# Altium project 24V-70A-Power-Board-v1.0.PrjPcb (part 3 of 8)
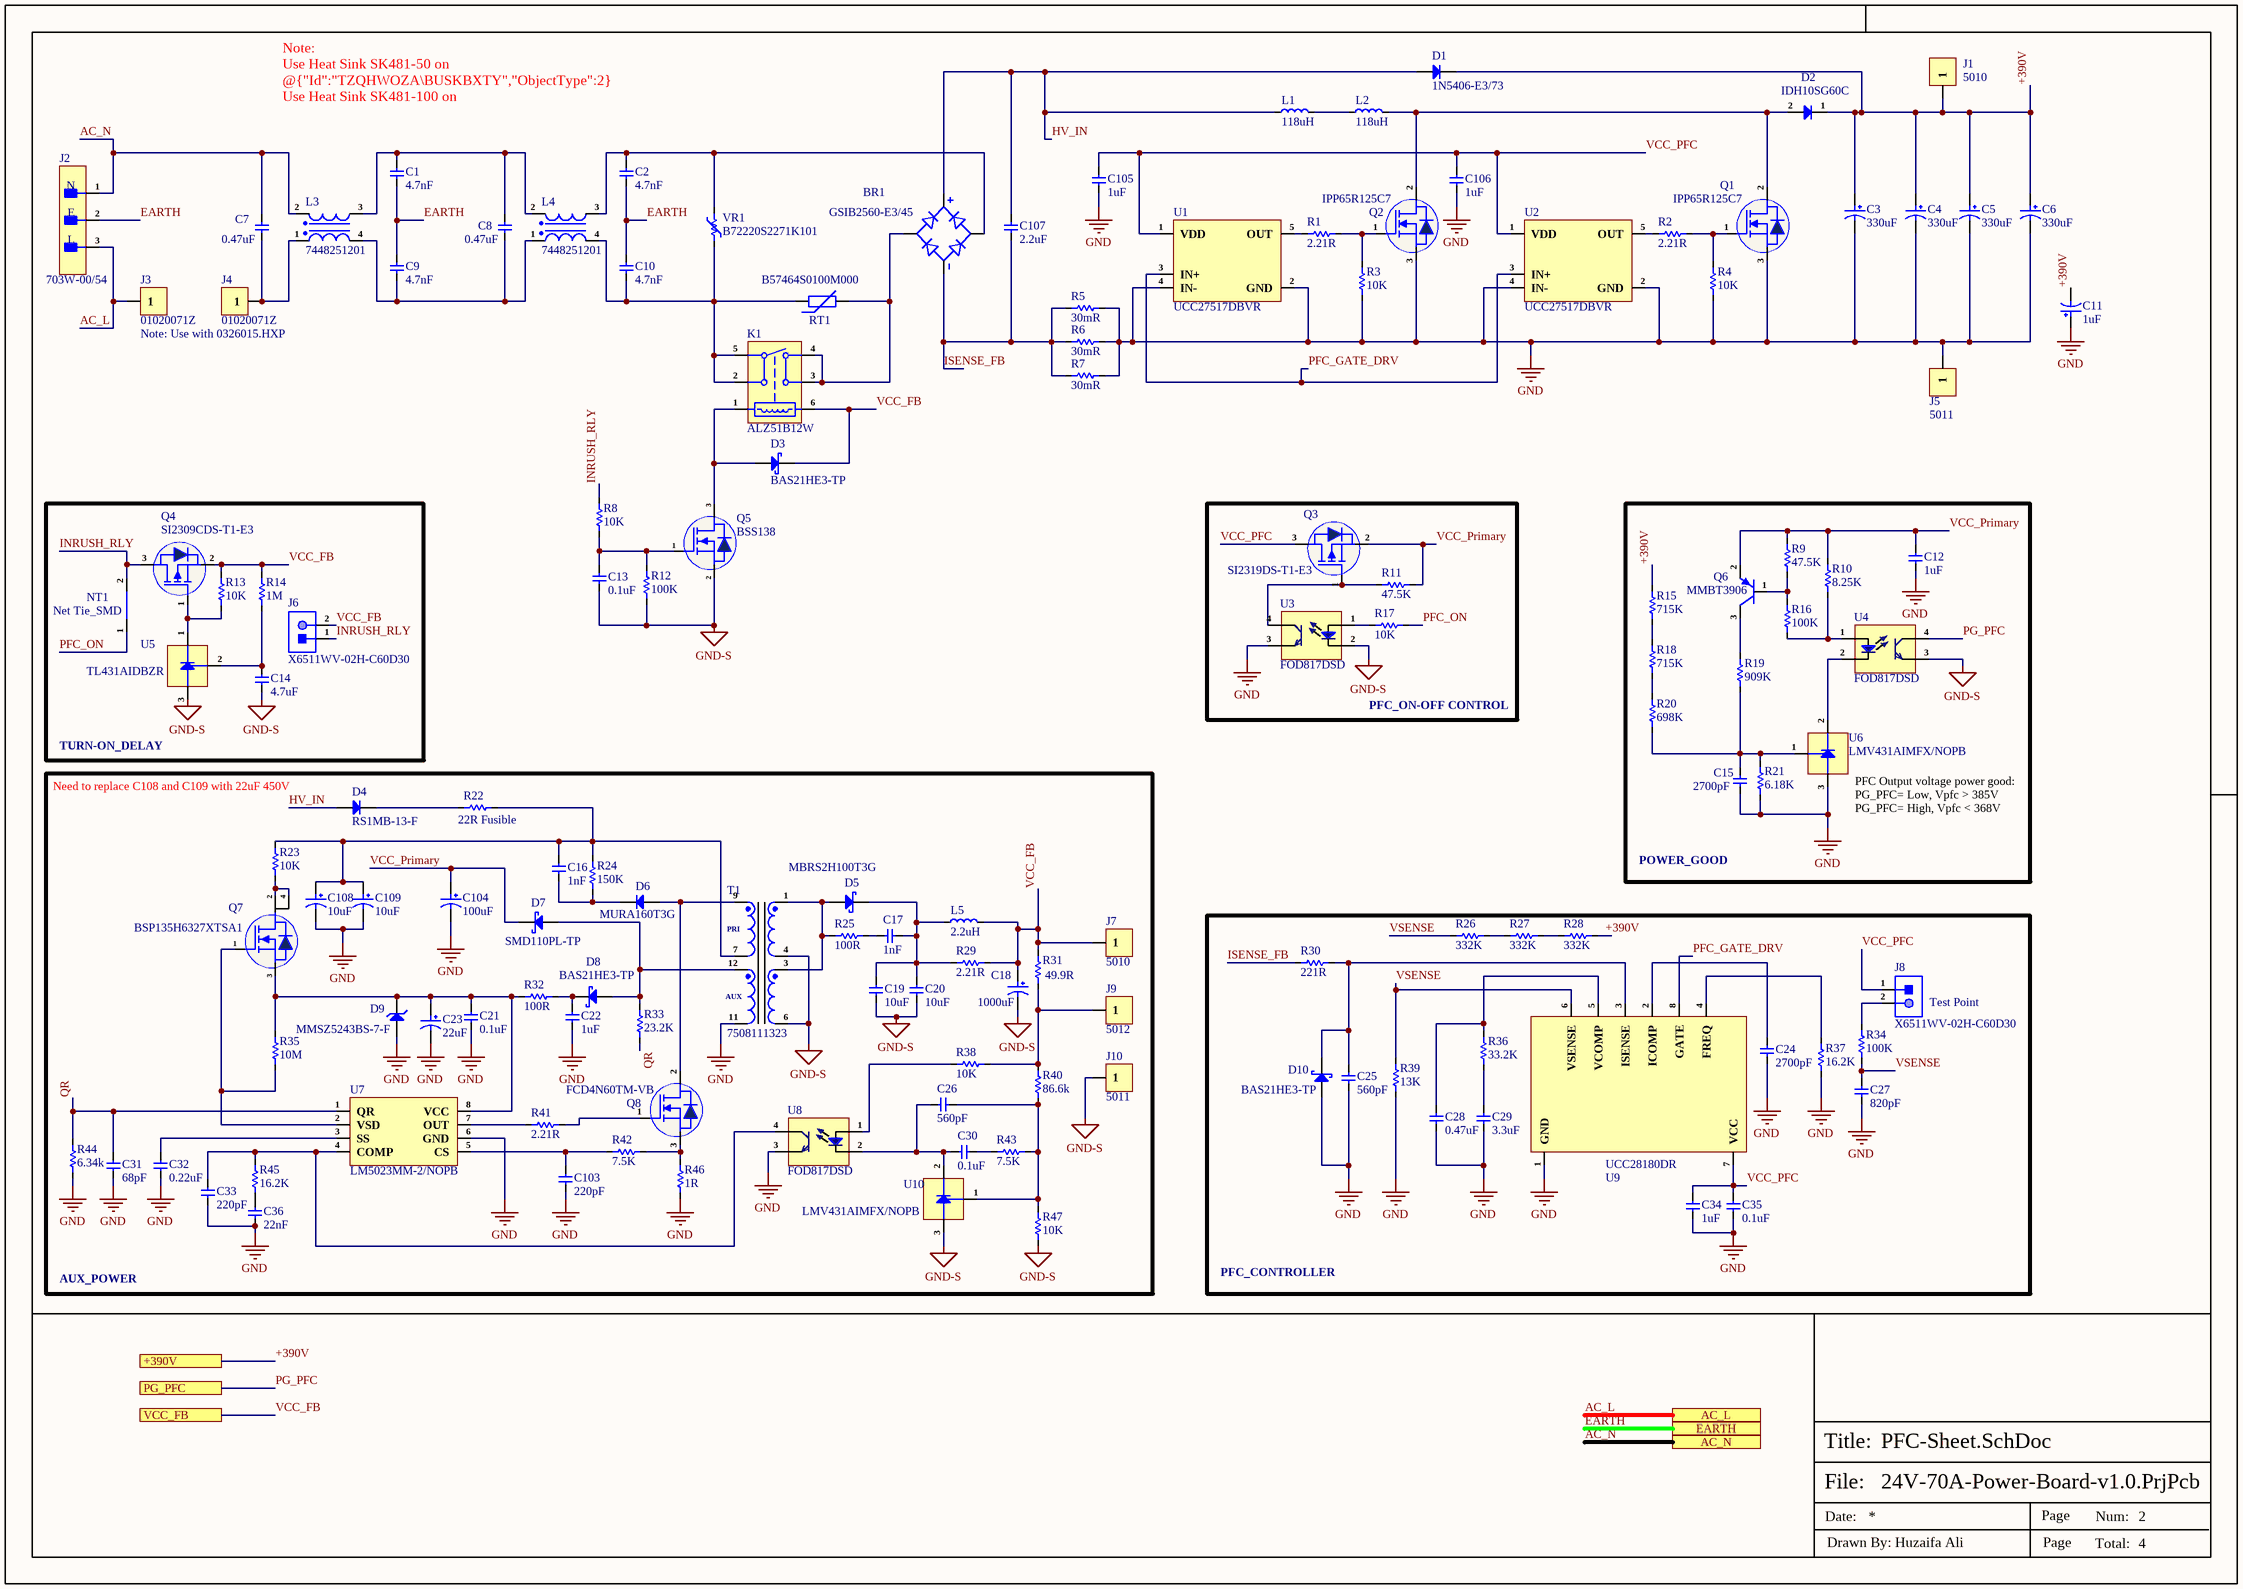
[diagram p5: PFC-Sheet.SchDoc]

## Sheet PFC-Sheet.SchDoc (continued)

### Notes on the sheet
- Note:
  Use Heat Sink SK481-50 on @{"Id":"TZQHWOZA\BUSKBXTY","ObjectType":2}
  Use Heat Sink SK481-100 on @{"Id":"TZQHWOZA\QHEAVWIM","ObjectType":2} @{"Id":"TZQHWOZA\GOCLJIOY","ObjectType":2} & @{"Id":"TZQHWOZA\RKNUICFK","ObjectType":2}
- Note: Use with 0326015.HXP
- Need to replace C108 and C109 with 22uF 450V
- (near U6) PFC Output voltage power good:
  PG_PFC= Low, Vpfc > 385V
  PG_PFC= High, Vpfc < 368V
- (near J8) Test Point
- AUX_POWER
- PFC_CONTROLLER
- File:
- Title:
- Date:
- Page
- Num:
- Total:
- Drawn By: Huzaifa Ali